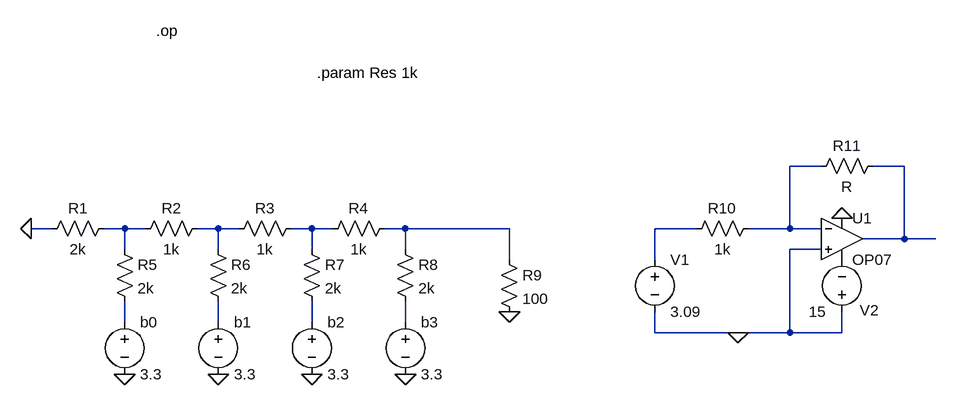
[diagram p0: schematic Draft6.asc]
Draft6.asc, the LTspice schematic file:
Version 4.1
SHEET 1 1460 680
WIRE 1280 48 1232 48
WIRE 1408 48 1360 48
WIRE 96 144 64 144
WIRE 208 144 176 144
WIRE 240 144 208 144
WIRE 352 144 320 144
WIRE 384 144 352 144
WIRE 496 144 464 144
WIRE 528 144 496 144
WIRE 640 144 608 144
WIRE 800 144 640 144
WIRE 1088 144 1024 144
WIRE 1232 144 1232 48
WIRE 1232 144 1168 144
WIRE 1280 144 1232 144
WIRE 1408 160 1408 48
WIRE 1408 160 1344 160
WIRE 1456 160 1408 160
WIRE 208 176 208 144
WIRE 352 176 352 144
WIRE 496 176 496 144
WIRE 640 176 640 144
WIRE 1280 176 1232 176
WIRE 800 192 800 144
WIRE 1024 192 1024 144
WIRE 208 288 208 256
WIRE 352 288 352 256
WIRE 496 288 496 256
WIRE 640 288 640 256
WIRE 1024 304 1024 272
WIRE 1152 304 1024 304
WIRE 1232 304 1232 176
WIRE 1232 304 1152 304
WIRE 1312 304 1312 272
WIRE 1312 304 1232 304
FLAG 64 144 0
FLAG 208 368 0
FLAG 352 368 0
FLAG 496 368 0
FLAG 640 368 0
FLAG 800 272 0
FLAG 1152 304 0
FLAG 1312 128 0
SYMBOL res 192 128 R90
WINDOW 0 0 56 VBottom 2
WINDOW 3 32 56 VTop 2
SYMATTR InstName R1
SYMATTR Value 2k
SYMBOL res 336 128 R90
WINDOW 0 0 56 VBottom 2
WINDOW 3 32 56 VTop 2
SYMATTR InstName R2
SYMATTR Value 1k
SYMBOL res 480 128 R90
WINDOW 0 0 56 VBottom 2
WINDOW 3 32 56 VTop 2
SYMATTR InstName R3
SYMATTR Value 1k
SYMBOL res 624 128 R90
WINDOW 0 0 56 VBottom 2
WINDOW 3 32 56 VTop 2
SYMATTR InstName R4
SYMATTR Value 1k
SYMBOL res 192 160 R0
SYMATTR InstName R5
SYMATTR Value 2k
SYMBOL res 336 160 R0
SYMATTR InstName R6
SYMATTR Value 2k
SYMBOL res 480 160 R0
SYMATTR InstName R7
SYMATTR Value 2k
SYMBOL res 624 160 R0
SYMATTR InstName R8
SYMATTR Value 2k
SYMBOL voltage 208 272 R0
WINDOW 123 0 0 Left 0
WINDOW 39 0 0 Left 0
SYMATTR InstName b0
SYMATTR Value 3.3
SYMBOL voltage 352 272 R0
WINDOW 123 0 0 Left 0
WINDOW 39 0 0 Left 0
SYMATTR InstName b1
SYMATTR Value 3.3
SYMBOL voltage 496 272 R0
WINDOW 123 0 0 Left 0
WINDOW 39 0 0 Left 0
SYMATTR InstName b2
SYMATTR Value 3.3
SYMBOL voltage 640 272 R0
WINDOW 123 0 0 Left 0
WINDOW 39 0 0 Left 0
SYMATTR InstName b3
SYMATTR Value 3.3
SYMBOL voltage 1024 176 R0
WINDOW 123 0 0 Left 0
WINDOW 39 0 0 Left 0
SYMATTR InstName V1
SYMATTR Value 3.09
SYMBOL res 1184 128 R90
WINDOW 0 0 56 VBottom 2
WINDOW 3 32 56 VTop 2
SYMATTR InstName R10
SYMATTR Value 1k
SYMBOL res 784 176 R0
SYMATTR InstName R9
SYMATTR Value 100
SYMBOL OpAmps\\OP07 1312 96 R0
SYMATTR InstName U1
SYMBOL voltage 1312 288 R180
WINDOW 0 -57 18 Left 2
WINDOW 3 24 16 Left 2
WINDOW 123 0 0 Left 0
WINDOW 39 0 0 Left 0
SYMATTR InstName V2
SYMATTR Value 15
SYMBOL res 1376 32 R90
WINDOW 0 0 56 VBottom 2
WINDOW 3 32 56 VTop 2
SYMATTR InstName R11
TEXT 256 -160 Left 2 !.op
TEXT 504 -96 Left 2 !.param Res 1k

The netlist it stands for:
* Draft6.asc
R1 N003 0 2k
R2 N004 N003 1k
R3 N005 N004 1k
R4 N006 N005 1k
R5 N003 N008 2k
R6 N004 N009 2k
R7 N005 N010 2k
R8 N006 N011 2k
V§b0 N008 0 3.3
V§b1 N009 0 3.3
V§b2 N010 0 3.3
V§b3 N011 0 3.3
V1 N007 0 3.09
R10 N001 N007 1k
R9 N006 0 100
X§U1 0 N001 0 P001 N002 LT1001  ; OP07, pins In+ In- V+ V- OUT
V2 0 P001 15
R11 N002 N001 R
.op
.param Res 1k
.lib LTC.lib
.backanno
.end